# Altium schematic sheet clock.SchDoc: Наименование
size 594 x 420 mm; ApprovedBy: Утвердил; CheckedBy: Проверил; Author: Разработал; CompanyName: ВлГУ; DrawnBy: Н.Контр; Engineer: Т.Контр; SheetNumber: 5; SheetTotal: 9; PageSetup: Record=PageOptions|CenterHorizontal=True|CenterVertical=True|PrintScale=0.94|XCorrection=1.00|YCorrection=1.00|PrintKind=1|BorderSize=5000000|LeftOffset=0|BottomOffset=0|Orientation=1|PaperLength=1000|PaperWidth=1000|Scale=100|PaperSource=7|PrintQuality=-4|MediaType=1|DitherType=10|PaperKind=A4|PrintScaleMode=1; DecimalNumber: Децимальный номер; HeadOfSector: Нач. сектора; MainDevice: Перв.примен.; Name: Наименование; DocumentName: Sheet1.SCHDOC
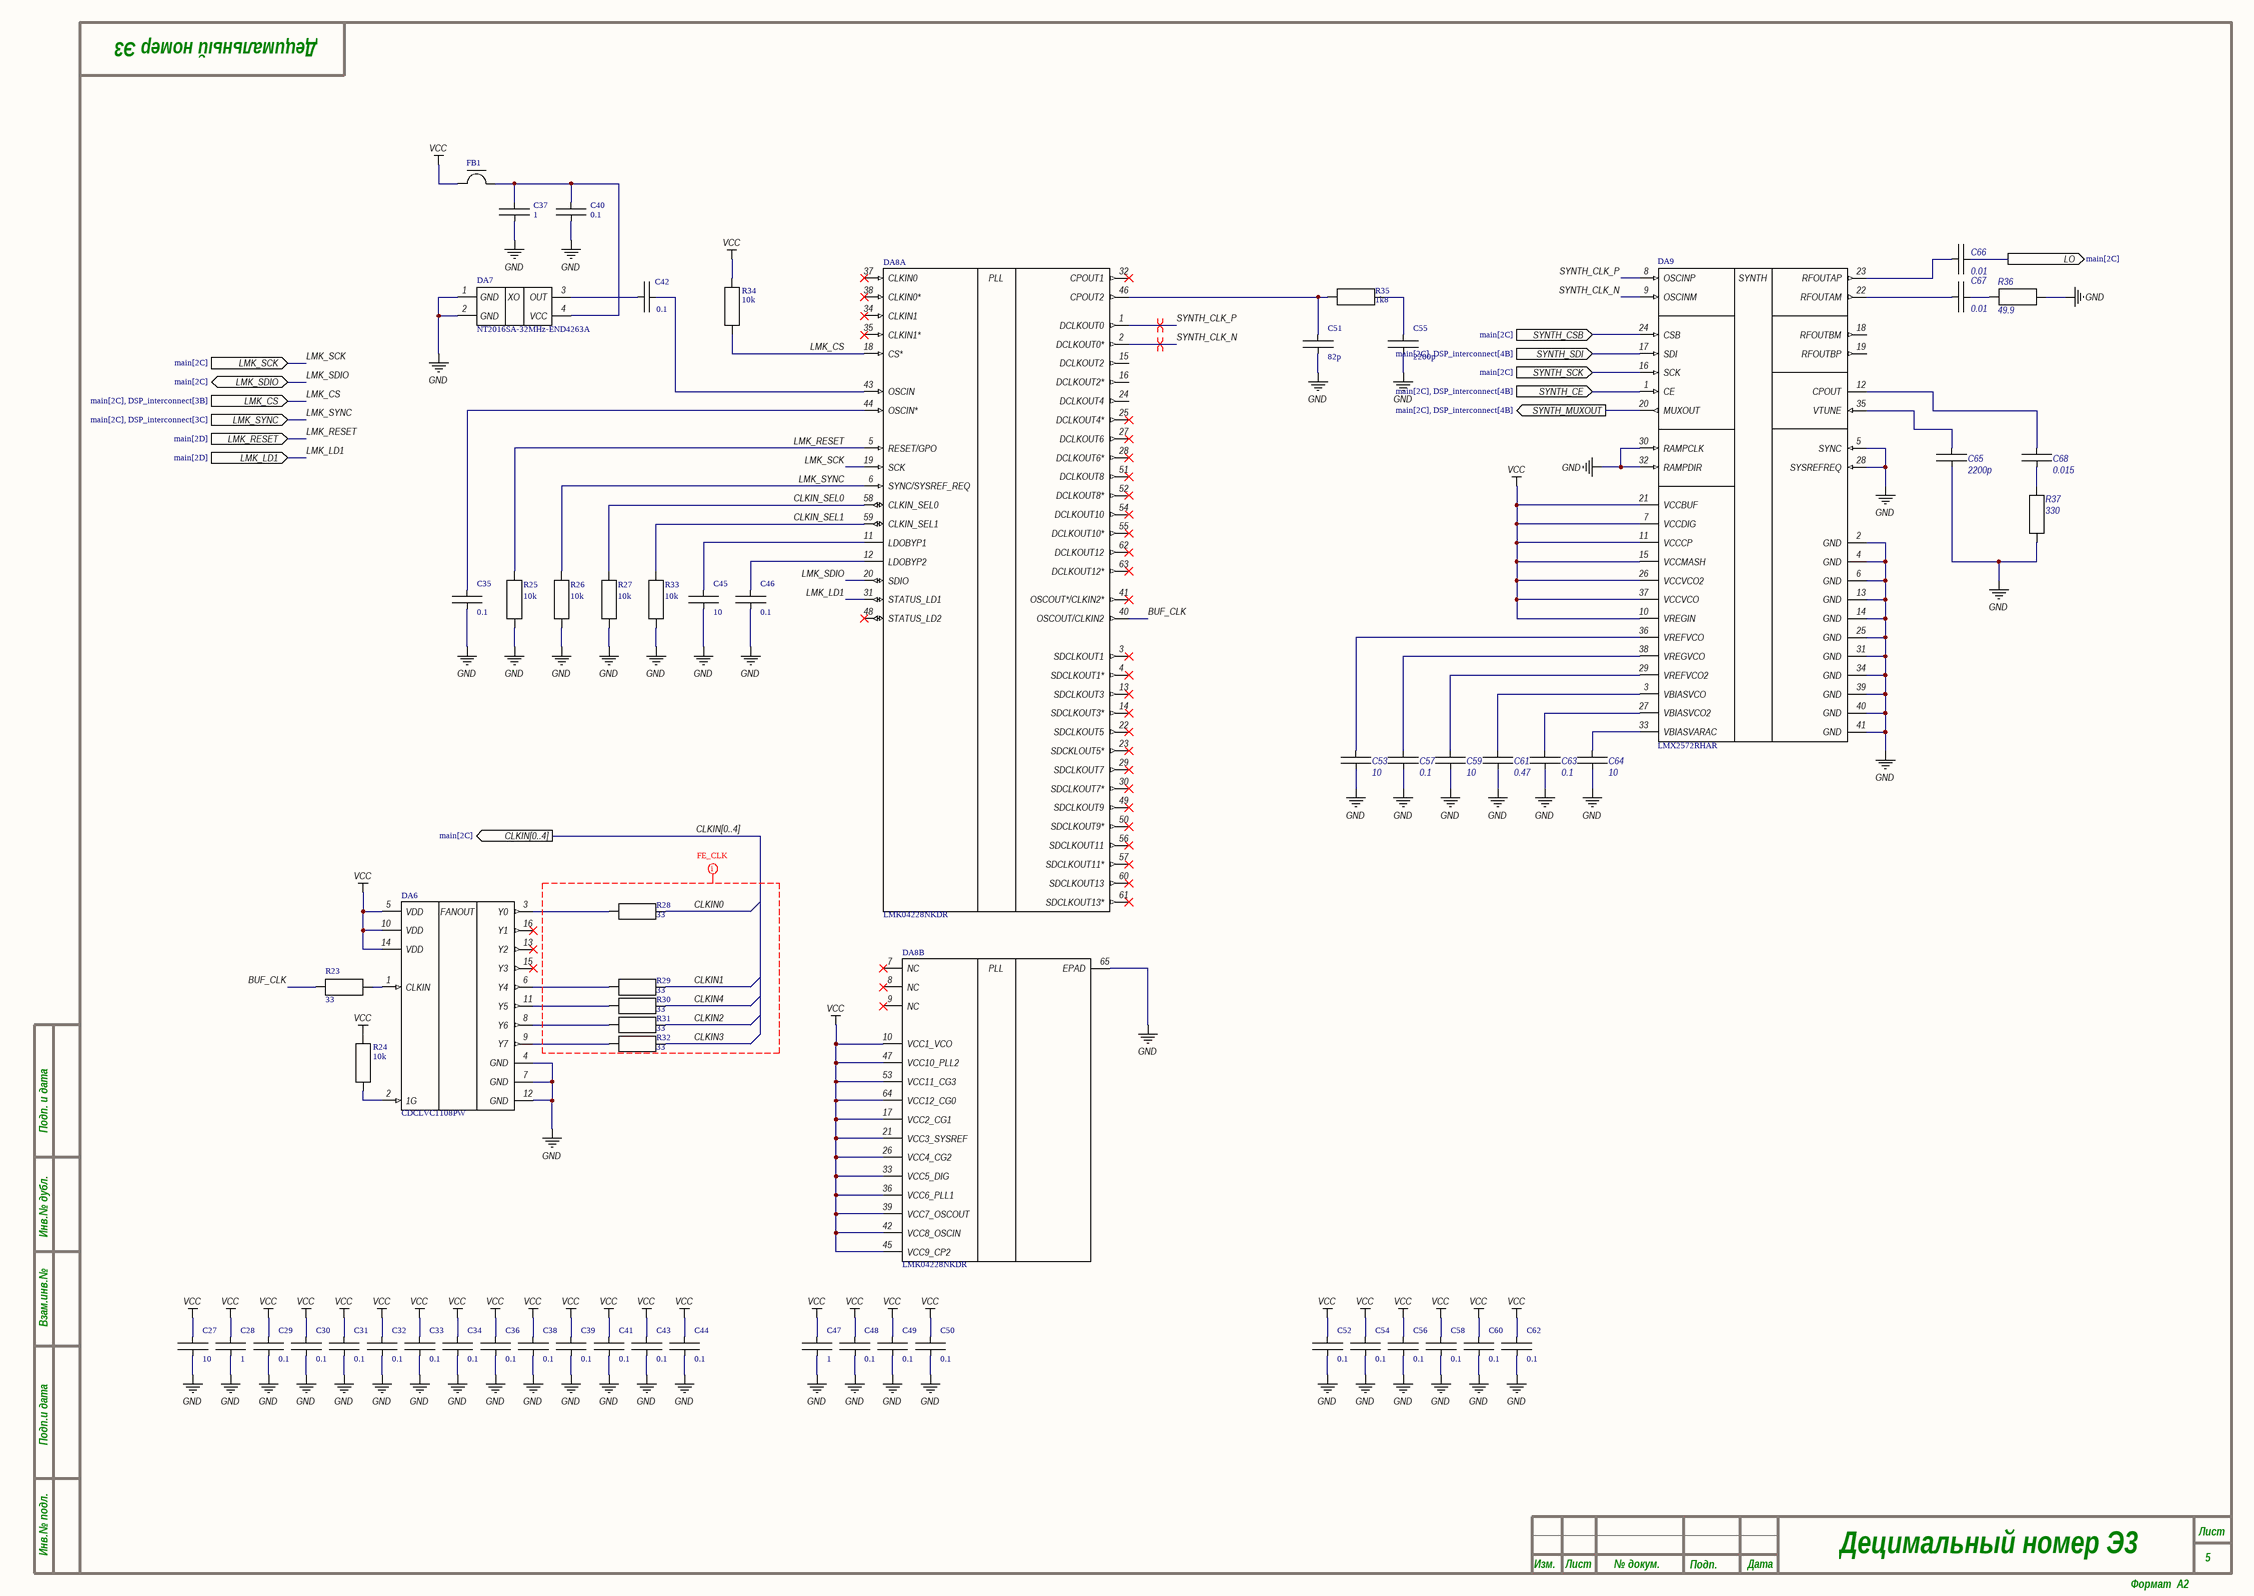
[diagram p0: clock.SchDoc]

## Parts
C27  10  [C0805C]
C28  1  [C0603C]
C29  0.1  [C0603C]
C30  0.1  [C0603C]
C31  0.1  [C0603C]
C32  0.1  [C0603C]
C33  0.1  [C0603C]
C34  0.1  [C0603C]
C35  0.1  [C0603C]
C36  0.1  [C0603C]
C37  1  [C0603C]
C38  0.1  [C0603C]
C39  0.1  [C0603C]
C40  0.1  [C0603C]
C41  0.1  [C0603C]
C42  0.1  [C0603C]
C43  0.1  [C0603C]
C44  0.1  [C0603C]
C45  10  [C0805C]
C46  0.1  [C0603C]
C47  1  [C0603C]
C48  0.1  [C0603C]
C49  0.1  [C0603C]
C50  0.1  [C0603C]
C51  82p  [C0603C]
C52  0.1  [C0603C]
C53  10  [C1206C]
C54  0.1  [C0603C]
C55  2200p  [C0603C]
C56  0.1  [C0603C]
C57  0.1  [C0805C]
C58  0.1  [C0603C]
C59  10  [C1206C]
C60  0.1  [C0603C]
C61  0.47  [C0805C]
C62  0.1  [C0603C]
C63  0.1  [C0805C]
C64  10  [C1206C]
C65  2200p  [C0603C]
C66  0.01  [C0402C]
C67  0.01  [C0402C]
C68  0.015  [C0603C]
DA6  CDCLVC1108PW  [TSSOP16]
DA7  NT2016SA-32MHz-END4263A  [OSC_CX2016DB16000D0WZRC1]
DA8  LMK04228NKDR  [WQFN64_NKD_TEX]  (parts A,B of 2)
DA9  LMX2572RHAR  [RHA0040H]
FB1  (no value)  [C0805I]
R23  33  [C0603R]
R24  10k  [C0603R]
R25  10k  [C0603R]
R26  10k  [C0603R]
R27  10k  [C0603R]
R28  33  [C0603R]
R29  33  [C0603R]
R30  33  [C0603R]
R31  33  [C0603R]
R32  33  [C0603R]
R33  10k  [C0603R]
R34  10k  [C0603R]
R35  1k8  [C0603R]
R36  49.9  [C0402R]
R37  330  [C0603R]

## Ports
CLKIN[0..4] (out, see main[2C]), LMK_CS (in, see main[2C], DSP_interconnect[3B]), LMK_LD1 (in, see main[2D]), LMK_RESET (in, see main[2D]), LMK_SCK (in, see main[2C]), LMK_SDIO (bidir, see main[2C]), LMK_SYNC (in, see main[2C], DSP_interconnect[3C]), LO (out, see main[2C]), SYNTH_CE (in, see main[2C], DSP_interconnect[4B]), SYNTH_CSB (in, see main[2C]), SYNTH_MUXOUT (out, see main[2C], DSP_interconnect[4B]), SYNTH_SCK (in, see main[2C]), SYNTH_SDI (in, see main[2C], DSP_interconnect[4B])

## Nets
GND: C27.2 C28.2 C29.2 C30.2 C31.2 C32.2 C33.2 C34.2 C35.2 C36.2 C37.2 C38.2 C39.2 C40.2 C41.2 C43.2 C44.2 C45.2 C46.2 C47.2 C48.2 C49.2 C50.2 C51.2 C52.2 C53.1 C54.2 C55.2 C56.2 C57.2 C58.2 C59.1 C60.2 C61.1 C62.2 C63.2 C64.1 C65.2 DA6.4(GND) DA6.7(GND) DA6.12(GND) DA7.1(GND) DA7.2(GND) DA8.65(EPAD) DA9.2(GND) DA9.4(GND) DA9.5(SYNC) DA9.6(GND) DA9.13(GND) DA9.14(GND) DA9.25(GND) DA9.28(SYSREFREQ) DA9.30(RAMPCLK) DA9.31(GND) DA9.32(RAMPDIR) DA9.34(GND) DA9.39(GND) DA9.40(GND) DA9.41(GND) R25.2 R26.2 R27.2 R33.2 R36.1 R37.2
VCC: C27.1 C28.1 C29.1 C30.1 C31.1 C32.1 C33.1 C34.1 C36.1 C38.1 C39.1 C41.1 C43.1 C44.1 C47.1 C48.1 C49.1 C50.1 C52.1 C54.1 C56.1 C58.1 C60.1 C62.1 DA6.5(VDD) DA6.10(VDD) DA6.14(VDD) DA8.10(VCC1_VCO) DA8.17(VCC2_CG1) DA8.21(VCC3_SYSREF) DA8.26(VCC4_CG2) DA8.33(VCC5_DIG) DA8.36(VCC6_PLL1) DA8.39(VCC7_OSCOUT) DA8.42(VCC8_OSCIN) DA8.45(VCC9_CP2) DA8.47(VCC10_PLL2) DA8.53(VCC11_CG3) DA8.64(VCC12_CG0) DA9.7(VCCDIG) DA9.10(VREGIN) DA9.11(VCCCP) DA9.15(VCCMASH) DA9.21(VCCBUF) DA9.26(VCCVCO2) DA9.37(VCCVCO) FB1.1 R24.1 R34.1
BUF_CLK: DA8.40(OSCOUT/CLKIN2) R23.2
CLKIN0: R28.1
CLKIN1: R29.1
CLKIN2: R31.1
CLKIN3: R32.1
CLKIN4: R30.1
CLKIN_SEL0: DA8.58(CLKIN_SEL0) R27.1
CLKIN_SEL1: DA8.59(CLKIN_SEL1) R33.1
LMK_CS: DA8.18(CS*) R34.2 ; port LMK_CS
LMK_LD1: DA8.31(STATUS_LD1) ; port LMK_LD1
LMK_RESET: DA8.5(RESET/GPO) R25.1 ; port LMK_RESET
LMK_SCK: DA8.19(SCK) ; port LMK_SCK
LMK_SDIO: DA8.20(SDIO) ; port LMK_SDIO
LMK_SYNC: DA8.6(SYNC/SYSREF_REQ) R26.1 ; port LMK_SYNC
LO: C66.2 ; port LO
SYNTH_CE: DA9.1(CE) ; port SYNTH_CE
SYNTH_CLK_N: DA8.2(DCLKOUT0*) DA9.9(OSCINM)
SYNTH_CLK_P: DA8.1(DCLKOUT0) DA9.8(OSCINP)
SYNTH_CSB: DA9.24(CSB) ; port SYNTH_CSB
SYNTH_MUXOUT: DA9.20(MUXOUT) ; port SYNTH_MUXOUT
SYNTH_SCK: DA9.16(SCK) ; port SYNTH_SCK
SYNTH_SDI: DA9.17(SDI) ; port SYNTH_SDI
NetC35_1: C35.1 DA8.44(OSCIN*)
NetC37_1: C37.1 C40.1 DA7.4(VCC) FB1.2
NetC42_1: C42.1 DA7.3(OUT)
NetC42_2: C42.2 DA8.43(OSCIN)
NetC45_1: C45.1 DA8.11(LDOBYP1)
NetC46_1: C46.1 DA8.12(LDOBYP2)
NetC51_1: C51.1 DA8.46(CPOUT2) R35.2
NetC53_2: C53.2 DA9.36(VREFVCO)
NetC55_1: C55.1 R35.1
NetC57_1: C57.1 DA9.38(VREGVCO)
NetC59_2: C59.2 DA9.29(VREFVCO2)
NetC61_2: C61.2 DA9.3(VBIASVCO)
NetC63_1: C63.1 DA9.27(VBIASVCO2)
NetC64_2: C64.2 DA9.33(VBIASVARAC)
NetC65_1: C65.1 DA9.35(VTUNE)
NetC66_1: C66.1 DA9.23(RFOUTAP)
NetC67_1: C67.1 DA9.22(RFOUTAM)
NetC67_2: C67.2 R36.2
NetC68_1: C68.1 DA9.12(CPOUT)
NetC68_2: C68.2 R37.1
NetDA6_1: DA6.1(CLKIN) R23.1
NetDA6_2: DA6.2(1G) R24.2
NetDA6_3: DA6.3(Y0) R28.2
NetDA6_6: DA6.6(Y4) R29.2
NetDA6_8: DA6.8(Y6) R31.2
NetDA6_9: DA6.9(Y7) R32.2
NetDA6_11: DA6.11(Y5) R30.2

Not connected (* = marked no-connect by the designer): DA6 13(Y2)* 15(Y3)* 16(Y1)*; DA8 3(SDCLKOUT1)* 4(SDCLKOUT1*)* 7(NC)* 8(NC)* 9(NC)* 13(SDCLKOUT3)* 14(SDCLKOUT3*)* 15(DCLKOUT2) 16(DCLKOUT2*) 22(SDCLKOUT5)* 23(SDCKLOUT5*)* 24(DCLKOUT4) 25(DCLKOUT4*)* 27(DCLKOUT6)* 28(DCLKOUT6*)* 29(SDCLKOUT7)* 30(SDCLKOUT7*)* 32(CPOUT1)* 34(CLKIN1)* 35(CLKIN1*)* 37(CLKIN0)* 38(CLKIN0*)* 41(OSCOUT*/CLKIN2*)* 48(STATUS_LD2)* 49(SDCLKOUT9)* 50(SDCLKOUT9*)* 51(DCLKOUT8)* 52(DCLKOUT8*)* 54(DCLKOUT10)* 55(DCLKOUT10*)* 56(SDCLKOUT11)* 57(SDCLKOUT11*)* 60(SDCLKOUT13)* 61(SDCLKOUT13*)* 62(DCLKOUT12)* 63(DCLKOUT12*)*; DA9 18(RFOUTBM) 19(RFOUTBP)

## Buses and harness runs
bus CLKIN[0..4] = port CLKIN[0..4]

## Layout directives
differential pair: SYNTH_CLK_N, SYNTH_CLK_P
net class FE_SYNC_CLK: CLKIN0, CLKIN1, CLKIN2, CLKIN3, CLKIN4

## Notes on the sheet
- Подп. и дата
- Инв.№ дубл.
- Взам.инв.№
- Подп.и дата
- Инв.№ подл.
- Изм.
- Лист
- № докум.
- Подп.
- Дата
- Формат  A2
- (in symbol CDCLVC1108PW) FANOUT
- (in symbol LMK04228NKDR, part A) PLL
- (in symbol LMK04228NKDR, part B) PLL
- (in symbol LMX2572RHAR) SYNTH
- (in symbol TCXO) XO

## Library data of the parts
C27-C52 C54-C56 C58 C60 C62 = Cap: TYPE: Capacitor; MAPPING: 2(1,2,100)(1,2,100)
  C27 C45: Value: 10
  C28 C37 C47: Value: 1
  C29-C36 C38-C44 C46 C48-C50 C52 C54 C56 C58 C60 C62: Value: 0.1
  C51: Value: 82p
  C55: Value: 2200p
C53 C57 C59 C61 C63-C68 = Cap
  C53 C59 C64: Value: 10
  C57 C63: Value: 0.1
  C61: Value: 0.47
  C65: Value: 2200p
  C66 C67: Value: 0.01
  C68: Value: 0.015
DA6 = CDCLVC1108PW: Low jitter, 1:8 LVCMOS fan-out clock buffer 16-TSSOP -40 to 85; Manufacturer_Name: Texas Instruments; PartNumber: CDCLVC1108PWR; CompType: IC; TYPE: TYPE; RefDes: RefDes; Copyright: Copyright (C) 2026 Ultra Librarian. All rights reserved.; Manufacturer_Part_Number: CDCLVC1108PW; Datasheet: https://www.ti.com/lit/gpn/cdclvc1108; Application_BuildNumber: *; Alternate_PartNumber: CDCLVC1108PW; PackageReference: PW0016A; MountType: SMT; RoHS: Y; Manufacturer: Texas Instruments
DA7 = TCXO: Part number: NT2016SA-32MHz-END4263A
DA8 = LMK04228NKDR: Ultra low-noise clock jitter cleaner with dual loop PLLs 64-WQFN -40 to 85; Manufacturer_Name: Texas Instruments; Copyright: Copyright (C) 2026 Ultra Librarian. All rights reserved.; Manufacturer_Part_Number: LMK04228NKDR; Datasheet: https://www.ti.com/lit/gpn/lmk04228; RefDes: RefDes; Type: Type
DA9 = LMX2572RHAR: 6.4-GHz low-power wideband RF synthesizer 40-VQFN -40 to 85; Manufacturer_Name: Texas Instruments; TYPE: TYPE; RefDes: RefDes; Copyright: Copyright (C) 2026 Ultra Librarian. All rights reserved.; Manufacturer_Part_Number: LMX2572RHAR
FB1 = FBEAD
R23 R24 R28-R32 R34 R35 = res: MAPPING: 2(1,2,100)(1,2,100); TYPE: Resistor
  R23 R28-R32: Value: 33
  R24 R34: Value: 10k
  R35: Value: 1k8
R25-R27 R33 R36 R37 = res
  R25-R27 R33: Value: 10k
  R36: Value: 49.9
  R37: Value: 330